# Altium schematic sheet LiIon Charger Protection Board.SchDoc
size 297 x 209 mm; Symbol: Drawing-Symbol_A4; Company: 嘉立创EDA; Version: V1.0; Page Size: A4; @Project Name: 锂电池充电板; @Update Date: 2026-08-12; @Create Date: 2026-08-12; Device: Drawing-Symbol_A4; @Board Name: Board1; @Page Name: P1; @Create Time: 10:04:04; @Page Count: 1; @Page No: 1; @Schematic Name: Schematic1; @Update Time: 10:04:04; @Assembly Variant: Basic; Border: 1; Title Block Position: 3; Size: A4; Width: 1170; Height: 825; Region Start: 1; X Region Count: 6; Y Region Count: 4; Blade Width: 10; SheetNumber: 1; SheetTotal: 1
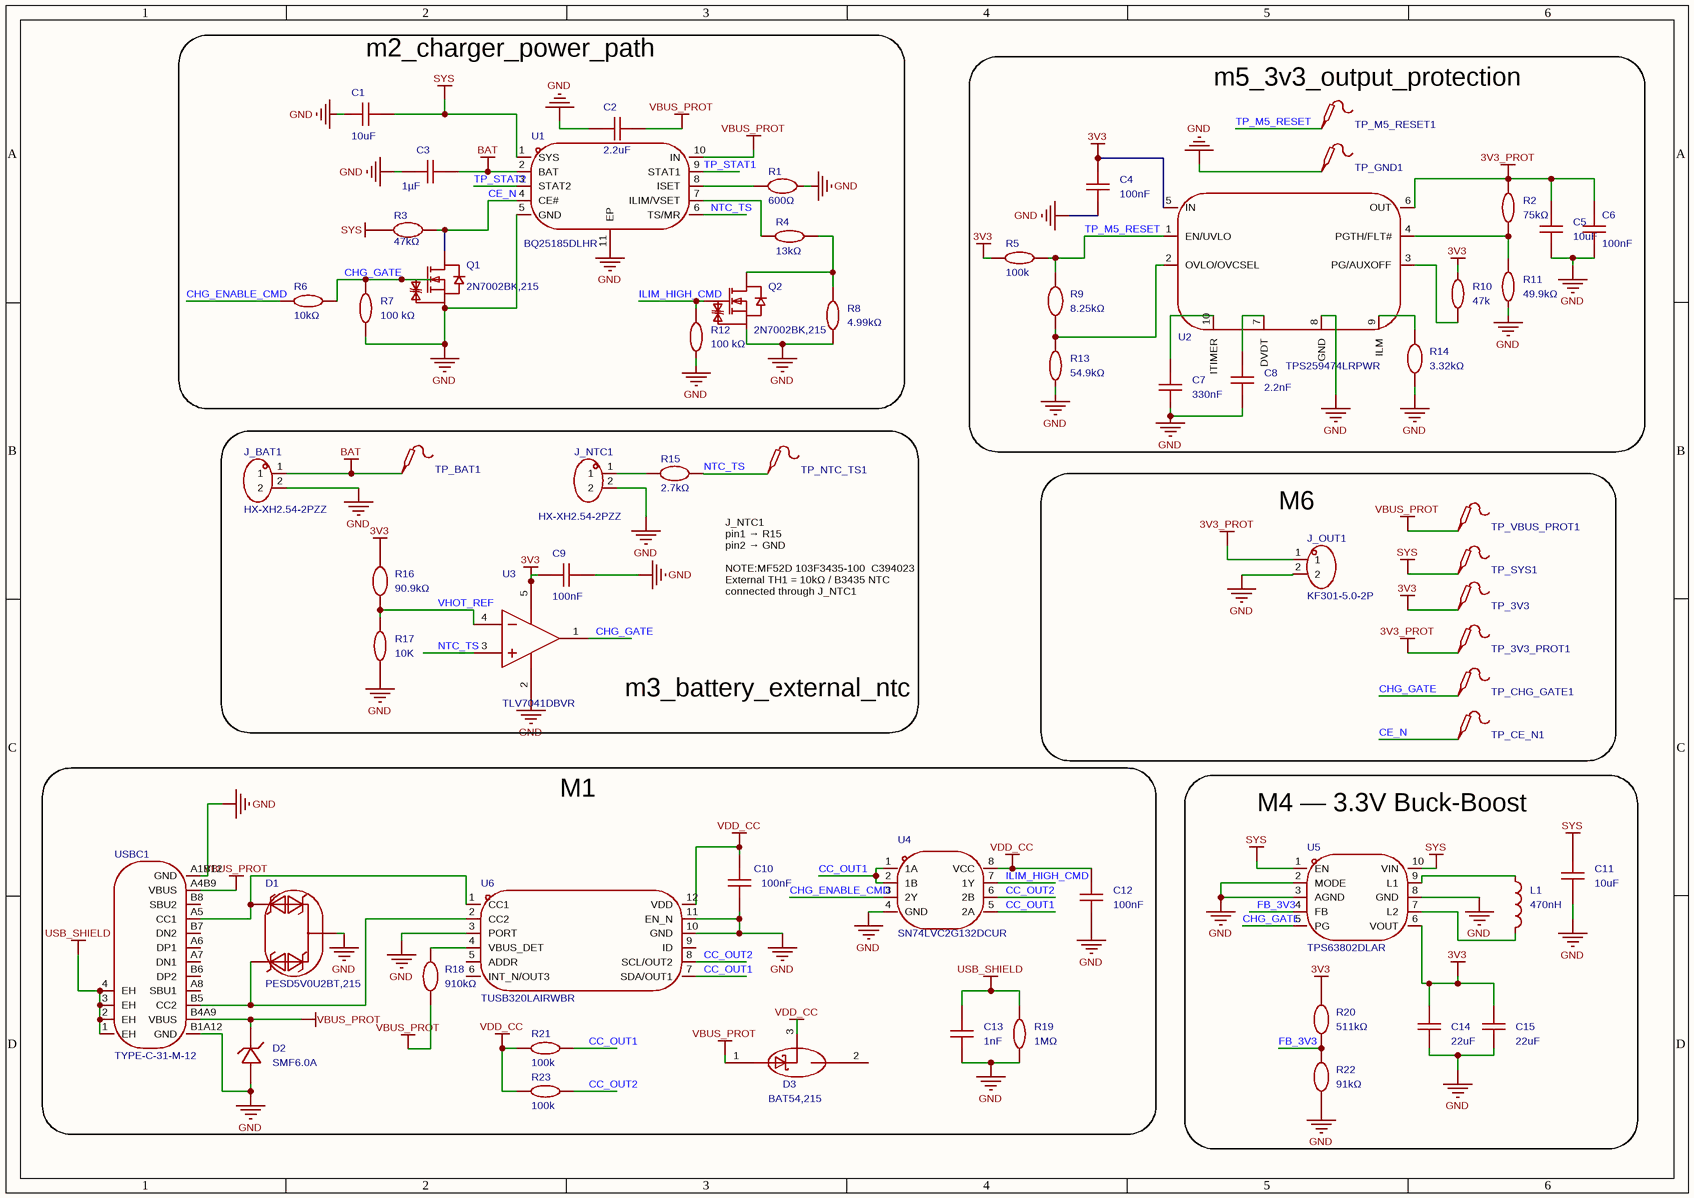
[diagram p0: LiIon Charger Protection Board.SchDoc]

## Parts
C1  10uF  [C0805]
C2  2.2uF  [C0603]
C3  1µF  [C0603]
C4  100nF  [C0603]
C5  10uF  [C0805]
C6  100nF  [C0603]
C7  330nF  [C0603]
C8  2.2nF  [C0603]
C9  100nF  [C0603]
C10  100nF  [C0603]
C11  10uF  [C0805]
C12  100nF  [C0603]
C13  1nF  [C1206]
C14  22uF  [C0805]
C15  22uF  [C0805]
D1  PESD5V0U2BT,215  [SOT-23-3_L2.9-W1.6-P1.90-LS2.8-BR]
D2  SMF6.0A  [SOD-123FL_L2.7-W1.8-LS3.8-RD]
D3  BAT54,215  [SOT-23_L2.9-W1.3-P1.90-LS2.4-BR]
J_BAT1  HX-XH2.54-2PZZ  [CONN-TH_2P-P2.50_HX-2.54MM-2P-ZZ-MS]
J_NTC1  HX-XH2.54-2PZZ  [CONN-TH_2P-P2.50_HX-2.54MM-2P-ZZ-MS]
J_OUT1  KF301-5.0-2P  [CONN-TH_P5.00_KF301-5.0-2P]
L1  470nH  [IND-SMD_L2.0-W1.6-1]
Q1  2N7002BK,215  [SOT-23-3_L3.0-W1.7-P0.95-LS2.9-BR]
Q2  2N7002BK,215  [SOT-23-3_L3.0-W1.7-P0.95-LS2.9-BR]
R1  600Ω  [R0805]
R2  75kΩ  [R0603]
R3  47kΩ  [R0603]
R4  13kΩ  [R0603]
R5  100k  [R0603]
R6  10kΩ  [R0603]
R7  100 kΩ  [R0603]
R8  4.99kΩ  [R0603]
R9  8.25kΩ  [R0603]
R10  47k  [R0603]
R11  49.9kΩ  [R0603]
R12  100 kΩ  [R0603]
R13  54.9kΩ  [R0603]
R14  3.32kΩ  [R0603]
R15  2.7kΩ  [R0603]
R16  90.9kΩ  [R0603]
R17  10K  [R0603]
R18  910kΩ  [R0603]
R19  1MΩ  [R1206]
R20  511kΩ  [R0603]
R21  100k  [R0603]
R22  91kΩ  [R0603]
R23  100k  [R0603]
TP_3V3  (no value)  [Test-Point-0.5mm]
TP_3V3_PROT1  (no value)  [Test-Point-0.5mm]
TP_BAT1  (no value)  [Test-Point-0.5mm]
TP_CE_N1  (no value)  [Test-Point-0.5mm]
TP_CHG_GATE1  (no value)  [Test-Point-0.5mm]
TP_GND1  (no value)  [Test-Point-0.5mm]
TP_M5_RESET1  (no value)  [Test-Point-0.5mm]
TP_NTC_TS1  (no value)  [Test-Point-0.5mm]
TP_SYS1  (no value)  [Test-Point-0.5mm]
TP_VBUS_PROT1  (no value)  [Test-Point-0.5mm]
U1  BQ25185DLHR  [WSON-10_L2.2-W2.0-P0.40-BL-EP_TI_DLH0010A]
U2  TPS259474LRPWR  [VQFN-10_L2.0-W2.0-P0.45-TL]
U3  TLV7041DBVR  [SOT-23-5_L2.9-W1.6-P0.95-LS2.8-BR]
U4  SN74LVC2G132DCUR  [US-8_L2.4-W2.1-P0.50-LS3.2-BR]
U5  TPS63802DLAR  [VSON-10_L3.0-W2.0-P0.50-TL]
U6  TUSB320LAIRWBR  [X2QFN-12_L1.6-W1.6-P0.40-TL]
USBC1  TYPE-C-31-M-12  [USB-C_SMD-TYPE-C-31-M-12_1]

## Blocks framed on the sheet
m2_charger_power_path: C1-C3 Q1 Q2 R1 R3 R4 R6-R8 R12 U1
m5_3v3_output_protection: C4-C8 R2 R5 R9-R11 R13 R14 TP_GND1 TP_M5_RESET1 U2
m3_battery_external_ntc: C9 J_BAT1 J_NTC1 R15-R17 TP_BAT1 TP_NTC_TS1 U3
M6: J_OUT1 TP_3V3 TP_3V3_PROT1 TP_CE_N1 TP_CHG_GATE1 TP_SYS1 TP_VBUS_PROT1
M1: C10 C12 C13 D1-D3 R18 R19 R21 R23 U4 U6 USBC1
M4 — 3.3V Buck-Boost: C11 C14 C15 L1 R20 R22 U5

## Nets
3V3: C4.2 C9.1 C14.2 C15.2 R5.1 R10.2 R16.2 R20.2 TP_3V3.1 U2.5(IN) U3.5(VCC) U5.6(VOUT)
3V3_PROT: C5.2 C6.2 J_OUT1.1 R2.2 TP_3V3_PROT1.1 U2.6(OUT)
BAT: C3.1 J_BAT1.1 TP_BAT1.1 U1.2(BAT)
GND: C1.1 C2.1 C3.2 C4.1 C5.1 C6.1 C7.1 C8.1 C9.2 C10.1 C11.1 C12.1 C13.1 C14.1 C15.1 D1.3 D2.2 J_BAT1.2 J_NTC1.2 J_OUT1.2 Q1.2(S) Q2.2(S) R1.2 R7.1 R8.1 R11.1 R12.1 R13.1 R14.1 R17.1 R19.1 R22.1 TP_GND1.1 U1.5(GND) U1.11(EP) U2.8(GND) U3.2(VEE) U4.4(GND) U5.2(MODE) U5.3(AGND) U5.8(GND) U6.3(PORT) U6.10(GND) U6.11(EN_N) USBC1.A1B12(GND) USBC1.B1A12(GND)
SYS: C1.2 C11.2 R3.2 TP_SYS1.1 U1.1(SYS) U5.1(EN) U5.10(VIN)
USB_SHIELD: C13.2 R19.2 USBC1.1(EH) USBC1.2(EH) USBC1.3(EH) USBC1.4(EH)
VBUS_PROT: C2.2 D2.1 D3.1(A) R18.1 TP_VBUS_PROT1.1 U1.10(IN) USBC1.A4B9(VBUS) USBC1.B4A9(VBUS)
VDD_CC: C10.2 C12.2 D3.3(C) R21.1 R23.2 U4.8(VCC) U6.12(VDD)
CC_OUT1: R21.2 U4.1(1A) U4.2(1B) U4.5(2A) U6.7(SDA/OUT1)
CC_OUT2: R23.1 U4.6(2B) U6.8(SCL/OUT2)
CE_N: Q1.3(D) R3.1 TP_CE_N1.1 U1.4(CE#)
CHG_ENABLE_CMD: R6.1 U4.3(2Y)
CHG_GATE: Q1.1(G) R6.2 R7.2 TP_CHG_GATE1.1 U3.1(OUT) U5.5(PG)
FB_3V3: R20.1 R22.2 U5.4(FB)
ILIM_HIGH_CMD: Q2.1(G) R12.2 U4.7(1Y)
NTC_TS: R15.2 TP_NTC_TS1.1 U1.6(TS/MR) U3.3(IN+)
TP_M5_RESET: R5.2 R9.2 TP_M5_RESET1.1 U2.1(EN/UVLO)
TP_STAT1: U1.9(STAT1)
TP_STAT2: U1.3(STAT2)
VHOT_REF: R16.1 R17.2 U3.4(IN-)
NetC7_2: C7.2 U2.10(ITIMER)
NetC8_2: C8.2 U2.7(DVDT)
NetD1_1: D1.1 U6.1(CC1) USBC1.A5(CC1)
NetD1_2: D1.2 U6.2(CC2) USBC1.B5(CC2)
NetJ_NTC1_1: J_NTC1.1 R15.1
NetL1_1: L1.1 U5.9(L1)
NetL1_2: L1.2 U5.7(L2)
NetQ2_3: Q2.3(D) R4.2 R8.2
NetR1_1: R1.1 U1.8(ISET)
NetR2_1: R2.1 R11.2 U2.4(PGTH/FLT#)
NetR4_1: R4.1 U1.7(ILIM/VSET)
NetR9_1: R9.1 R13.2 U2.2(OVLO/OVCSEL)
NetR10_1: R10.1 U2.3(PG/AUXOFF)
NetR14_2: R14.2 U2.9(ILM)
NetR18_2: R18.2 U6.4(VBUS_DET)

Not connected (* = marked no-connect by the designer): D3 2(NC); U6 5(ADDR) 6(INT_N/OUT3) 9(ID); USBC1 A6(DP1) A7(DN1) A8(SBU1) B6(DP2) B7(DN2) B8(SBU2)

## Notes on the sheet
- J_NTC1
  pin1 → R15
  pin2 → GND
  NOTE:MF52D 103F3435-100  C394023
  External TH1 = 10kΩ / B3435 NTC
  connected through J_NTC1

## Library data of the parts
C1 C5 C11 = CL21A106KAYNNNE_C15850: 容值:10uF;精度:±10%;额定电压:25V;温度系数:X5R;; Manufacturer: SAMSUNG(三星); Add into BOM: yes; 3D Model: 1ba041120af144c991958decab20d241; 3D Model Transform: 78.74,51.181,0,0,0,0,0,0.0005,0; Tolerance: ±10%; Voltage Rating: 25V; Temperature Coefficient: X5R; ModelName: C0805_L2.0-W1.3-H1.3; Symbol: CL21A106KAYNNNE; Device: CL21A106KAYNNNE_C15850; Convert to PCB: yes; Value: 10uF; Supplier Footprint: 0805; LCSC Part Name: 10uF ±10% 25V; Supplier Part: C15850; Manufacturer Part: CL21A106KAYNNNE; JLCPCB Part Class: Basic Part; Datasheet: https://item.szlcsc.com/datasheet/CL21A106KAYNNNE/16532.html; Supplier: LCSC; FootprintName: C0805
C2 = CL10A225KA8NNNC: 容值:2.2uF;精度:±10%;额定电压:25V;温度系数:X5R;; Manufacturer: SAMSUNG(三星); Add into BOM: yes; 3D Model: ac125912035d415993ca9572d50418b1; 3D Model Transform: 62.992,31.496,0,0,0,0,0,0,0; Tolerance: ±10%; Voltage Rating: 25V; Temperature Coefficient: X5R; ModelName: C0603_L1.6-W0.8-H0.8; Symbol: CL10A225KA8NNNC; Device: CL10A225KA8NNNC; Convert to PCB: yes; Value: 2.2uF; Supplier Footprint: 0603; LCSC Part Name: 2.2uF ±10% 25V; Supplier Part: C57895; Manufacturer Part: CL10A225KA8NNNC; JLCPCB Part Class: Extended Part; Datasheet: https://item.szlcsc.com/datasheet/CL10A225KA8NNNC/58932.html; Supplier: LCSC; FootprintName: C0603
C3 C9 = CAP_0603: Symbol: Capacitance; ConvertToPcb: yes; ModelId: ac125912035d415993ca9572d50418b1聨0819f05c4eef4c71ace90d822a990e87; ModelName: C0603_L1.6-W0.8-H0.8; ModelTransform: 62.992,31.496,0,0,0,0,0,0,0; Device: CAP_0603; AddInBom: yes; Supplier Footprint: 0603; FootprintName: C0603
  C3: Value: 1µF
  C9: Value: 100nF
C4 C6-C8 C10 C12 = CAP_0603: Symbol: Capacitance; 3D Model: ac125912035d415993ca9572d50418b1聨0819f05c4eef4c71ace90d822a990e87; 3D Model Transform: 62.992,31.496,0,0,0,0,0,0,0; ConvertToPcb: yes; ModelName: C0603_L1.6-W0.8-H0.8; Device: CAP_0603; Supplier Footprint: 0603; AddInBom: yes; FootprintName: C0603
  C4 C6 C10 C12: Value: 100nF
  C7: Value: 330nF
  C8: Value: 2.2nF
C13 = GRM31C5C3A102JWA3L: 容值:1nF;精度:±5%;额定电压:1kV;温度系数:C0G;; Manufacturer: muRata(村田); AddInBom: yes; ModelId: e4be705b945545a48e666415e3682bd8聨0819f05c4eef4c71ace90d822a990e87; ModelName: C1206_L3.2-W1.6-H1.3; ModelTransform: 125.984,62.992,0,0,0,0,0,0,0; Tolerance: ±5%; Voltage Rating: 1kV; Temperature Coefficient: C0G; Symbol: GRM31C5C3A102JWA3L; Device: GRM31C5C3A102JWA3L; LCSC Part Name: 1nF ±5% 1kV; SupplierPart: C521240; ManufacturerPart: GRM31C5C3A102JWA3L; Supplier Footprint: 1206; JLCPCB Part Class: Extended Part; Datasheet: https://item.szlcsc.com/datasheet/GRM31C5C3A102JWA3L/538323.html; Supplier: LCSC; ConvertToPcb: yes; FootprintName: C1206; Value: 1nF
C14 C15 = GRM21BR61E226ME44L: 容值:22uF;精度:±20%;额定电压:25V;温度系数:X5R;; Manufacturer: muRata(村田); Add into BOM: yes; 3D Model: 1ba041120af144c991958decab20d241; 3D Model Transform: 78.74,51.181,0,0,0,0,0,0.0005,0; Tolerance: ±20%; Voltage Rating: 25V; Temperature Coefficient: X5R; ModelName: C0805_L2.0-W1.3-H1.3; Symbol: GRM21BR61E226ME44L; Device: GRM21BR61E226ME44L; Convert to PCB: yes; Supplier Footprint: 0805; Value: 22uF; LCSC Part Name: 22uF ±20% 25V; Supplier Part: C86816; Manufacturer Part: GRM21BR61E226ME44L; JLCPCB Part Class: Extended Part; Datasheet: https://item.szlcsc.com/datasheet/GRM21BR61E226ME44L/87993.html; Supplier: LCSC; FootprintName: C0805
D1 = PESD5V0U2BT,215: 极性:双向;反向截止电压(Vrwm):5V;击穿电压:5.5V;; Manufacturer: Nexperia(安世); AddInBom: yes; ModelId: 89cb27a44ab2466697082bb9fd73a7d0聨0819f05c4eef4c71ace90d822a990e87; ModelName: SOT-23-3L_L2.9-W1.6-H1.1-LS2.8-P0.95; ModelTransform: 114.173,110.236,0,90,0,0,0,0,0; Polarity: 双向; Reverse Stand-Off Voltage (Vrwm): 5V; Voltage - Breakdown: 5.5V; Reverse Leakage Current (Ir): 5nA; Number of Channels: 双路; level of protection: IEC 61000-4-2; Type: ESD; Junction Capacitance: 2.9pF; Symbol: PESD5V0U2BT,215; Device: PESD5V0U2BT,215; LCSC Part Name: 双向ESD; SupplierPart: C85399; ManufacturerPart: PESD5V0U2BT,215; Supplier Footprint: SOT-23; JLCPCB Part Class: Extended Part; Datasheet: https://item.szlcsc.com/datasheet/PESD5V0U2BT%252C215/86572.html; Supplier: LCSC; ConvertToPcb: yes; FootprintName: SOT-23-3_L2.9-W1.6-P1.90-LS2.8-BR; Operating Temperature: -65℃~+150℃@(Ta)
D2 = SMF6.0A_C207260: 极性:单向;反向截止电压(Vrwm):6V;钳位电压:10.3V;峰值脉冲电流(Ipp):19.4A@10/1000us;峰值脉冲功率(Ppp):200W@10/1000us;击穿电压(VBR):7.37V;; Manufacturer: Littelfuse(美国力特); AddInBom: yes; ModelId: 86f9151e155e4fe2af0c4f2e0a80302e聨0819f05c4eef4c71ace90d822a990e87; ModelName: SOD-123FL_L2.8-W1.8-H1.1-LS3.6; ModelTransform: 141.732,70.866,0,180,0,0,0,0,0; Polarity: 单向; Reverse Stand-Off Voltage (Vrwm): 6V; Clamping Voltage: 10.3V; Voltage - Breakdown: 7.37V; Reverse Leakage Current (Ir): 400uA; level of protection: IEC 61000-4-4；IEC 61000-4-2; Type: TVS; Symbol: SMF6.0A_C207260; Device: SMF6.0A_C207260; LCSC Part Name: VBR=7.37V ，Vc=10.3V， Ipp=19.4A; SupplierPart: C207260; ManufacturerPart: SMF6.0A; Supplier Footprint: SOD-123FL; JLCPCB Part Class: Extended Part; Datasheet: https://item.szlcsc.com/datasheet/SMF6.0A/208379.html; Supplier: LCSC; ConvertToPcb: yes; FootprintName: SOD-123FL_L2.7-W1.8-LS3.8-RD; Peak Pulse Current (Ipp): 19.4A@10/1000us; Peak Pulse Power Dissipation (Ppp): 200W@10/1000us; Number of Channels: -; Operating Temperature: -65℃~+150℃; Junction Capacitance: -
D3 = BAT54,215: 正向压降(Vf):800mV@100mA;直流反向耐压(Vr):30V;整流电流:200mA;; Manufacturer: Nexperia(安世); AddInBom: yes; ModelId: c62791f0466c4ae2a892c056b845b0ca聨0819f05c4eef4c71ace90d822a990e87; ModelName: SOT-23-3P_L2.9-W1.3-H1.0-LS2.4-P0.95; ModelTransform: 98.64468,114.173,0,180,0,0,0.001,-0.002,0; Voltage - DC Reverse(Vr): 30V; Current - Rectified: 200mA; Reverse Leakage Current (Ir): 2uA@25V; Non-Repetitive Peak Forward Surge Current: 600mA; Symbol: BAT54,215; Device: BAT54,215; LCSC Part Name: 电压:30V 电流:200mA; SupplierPart: C85084; ManufacturerPart: BAT54,215; Supplier Footprint: SOT-23; JLCPCB Part Class: Extended Part; Datasheet: https://item.szlcsc.com/datasheet/BAT54%252C215/86256.html; Supplier: LCSC; ConvertToPcb: yes; FootprintName: SOT-23_L2.9-W1.3-P1.90-LS2.4-BR; Voltage - Forward(Vf@If): 800mV@100mA
J_BAT1 J_NTC1 = HX-XH2.54-2PZZ: 插针结构:1x2P;间距:2.54mm;安装方式:直插;参考系列:XH;总PIN数:2P;排数:1;每排PIN数:2;行距:-;额定电流:3A;触头材质:黄铜;触头镀层:锡;工作温度:-25℃~+85℃;; Manufacturer: hanxia(韩下); AddInBom: yes; ModelId: 1cafe43f43c04794b29c478db770ea2f聨0819f05c4eef4c71ace90d822a990e87; ModelTransform: 295.275,228.7397,0,0,0,0,0,-19.685,-137.795; Pins Structure: 1x2P; Pitch: 2.54mm; Reference Series: XH; Number of PINs Per Row: 2; Current Rating: 3A; Voltage Rating: 250V; Plastic Material: PA66; Flame Retardant Rating: UL94V-0; Symbol: HX-XH2.54-2PZZ; Device: HX-XH2.54-2PZZ; LCSC Part Name: 1x2P 间距:2.54mm 直插 系列:XH; SupplierPart: C42391660; Supplier Footprint: 插件,P=2.5mm; JLCPCB Part Class: Extended Part; Datasheet: https://item.szlcsc.com/datasheet/HX-XH2.54-2PZZ/44326932.html; Supplier: LCSC; ConvertToPcb: yes; FootprintName: CONN-TH_2P-P2.50_HX-2.54MM-2P-ZZ-MS; ModelName: CONN-TH_2P-P2.50_HX-2.54MM-2P-ZZ-MS; Mounting Type: 直插; Number of Pins: 2P; Number of Rows: 1; Row Spacing: -; Contact Material: 黄铜; Contact Plating: 锡; Operating Temperature: -25℃~+85℃; Color: 白色
  J_BAT1: ManufacturerPart: HX-XH2.54-2PZZ
  J_NTC1: Manufacturer Part: HX-XH2.54-2PZZ
J_OUT1 = KF301-5.0-2P: 结构:1x2P;间距:5mm;颜色:蓝色;安装方式:直插;排数:1;每排PIN数:2;额定电流:17A;额定电压:250V;线规 - AWG:14~22;线规 - 平方毫米:1.5;工作温度:-30℃~+120℃;; Manufacturer: KEFA(科发); AddInBom: yes; ModelId: 442de893d0fc4728b9e5c7abc29ccda5聨0819f05c4eef4c71ace90d822a990e87; ModelTransform: 417.322,299.21594,0,0,0,0,11.811,7.874,-137.795; Number of Positions or Pins: 1x2P; Pitch: 5mm; Number of PINs Per Row: 2; Current Rating: 17A; Voltage Rating (Max): 250V; Wire Gauge - AWG: 14~22; Wire Gauge - mm2: 1.5; Symbol: KF301-5.0-2P; Device: KF301-5.0-2P; LCSC Part Name: 1x2P 5mm 直插 排数:1 每排P数:2; SupplierPart: C474881; ManufacturerPart: KF301-5.0-2P; Supplier Footprint: 插件,P=5mm; JLCPCB Part Class: Extended Part; Datasheet: https://item.szlcsc.com/datasheet/KF301-5.0-2P/481499.html; Supplier: LCSC; ConvertToPcb: yes; FootprintName: CONN-TH_P5.00_KF301-5.0-2P; ModelName: CONN-TH_P5.00_KF301-5.0-2P; Color: 蓝色; Mounting Type: 直插; Number of Pins: 2P; Number of Rows: 1; Operating Temperature: -30℃~+120℃
L1 = DFE201612E-R47M=P2: 电感值:470nH;精度:±20%;额定电流:4.5A;饱和电流(Isat):5.5A;; Manufacturer: muRata(村田); Add into BOM: yes; 3D Model: e46c02e66e4b482b810d7eae4ef76c7b; 3D Model Transform: 78.74,62.992,0,0,0,0,0,-0.003,0; Tolerance: ±20%; Current Rating: 4.5A; Current - Saturation(Isat): 5.5A; DC Resistance(DCR): 26mΩ; Symbol: DFE201612E-R47M=P2; Device: DFE201612E-R47M=P2; Convert to PCB: yes; LCSC Part Name: 470nH ±20% 5.5A; Supplier Part: C668312; Manufacturer Part: DFE201612E-R47M=P2; Supplier Footprint: 0806; JLCPCB Part Class: Extended Part; Datasheet: https://atta.szlcsc.com/upload/public/pdf/source/20220704/803E7827D5B93CBE7ABCC328F9E8474C.pdf; Supplier: LCSC; Value: 470nH; Ratings: -; FootprintName: IND-SMD_L2.0-W1.6-1; ModelName: IND-SMD_L2.0-W1.6-1
Q1 Q2 = 2N7002BK,215: 数量:1个N沟道;漏源电压(Vdss):60V;连续漏极电流(Id):350mA;导通电阻(RDS(on)):1.6Ω@10V;耗散功率(Pd):370mW;阈值电压(Vgs(th)):2.1V;; Manufacturer: Nexperia(安世); AddInBom: yes; ModelId: 89cb27a44ab2466697082bb9fd73a7d0聨0819f05c4eef4c71ace90d822a990e87; ModelName: SOT-23-3L_L2.9-W1.6-H1.1-LS2.8-P0.95; ModelTransform: 114.173,110.236,0,90,0,0,0,0,0; Number: 1个N沟道; Drain to Source Voltage: 60V; Current - Continuous Drain(Id): 350mA; Pd - Power Dissipation: 370mW; Gate Threshold Voltage (Vgs(th)): 2.1V; Gate Charge(Qg): 600pC@4.5V; Input Capacitance(Ciss): 50pF; Reverse Transfer Capacitance (Crss@Vds): 4pF; Type: N沟道; Symbol: 2N7002BK,215; Device: 2N7002BK,215; LCSC Part Name: 1个N沟道 耐压:60V 电流:350mA; SupplierPart: C282405; ManufacturerPart: 2N7002BK,215; Supplier Footprint: SOT-23; JLCPCB Part Class: Extended Part; Datasheet: https://item.szlcsc.com/datasheet/2N7002BK%252C215/268403.html; Supplier: LCSC; ConvertToPcb: yes; FootprintName: SOT-23-3_L3.0-W1.7-P0.95-LS2.9-BR; RDS(on): 1.6Ω@10V; Operating Temperature: -55℃~+150℃
R1 = CRCW0805600RFKEAHP: 阻值:600Ω;精度:±1%;功率:500mW;工作电压:150V;温度系数:±100ppm/℃;; Manufacturer: VISHAY(威世); Add into BOM: yes; 3D Model: 37a81e68749a4138bd2dfa6897b24b85; 3D Model Transform: 78.74,51.181,0,0,0,0,0,-0.0005,0; Tolerance: ±1%; Power(Watts): 500mW; Voltage-Supply(Max): 150V; ModelName: R0805_L2.0-W1.3-H0.6; Symbol: CRCW0805600RFKEAHP; Device: CRCW0805600RFKEAHP; Convert to PCB: yes; Value: 600Ω; Supplier Footprint: 0805; LCSC Part Name: 脉冲耐受、高功率厚膜片式电阻; Supplier Part: C19725604; Manufacturer Part: CRCW0805600RFKEAHP; JLCPCB Part Class: Extended Part; Datasheet: https://item.szlcsc.com/datasheet/CRCW0805600RFKEAHP/21048958.html; Supplier: LCSC; Temperature Coefficient: ±100ppm/℃; Operating Temperature: -55℃~+155℃; FootprintName: R0805
R2 = 0603WAF7502T5E: 电阻类型:厚膜电阻;阻值:75kΩ;精度:±1%;功率:100mW;工作电压:75V;温度系数:±100ppm/℃;; Manufacturer: UNI-ROYAL(厚声); Add into BOM: yes; 3D Model: fc143cca1e79419f9cd78b61e9279f08; 3D Model Transform: 31.8897,63.7794,0,90,0,0,0,0,0; Tolerance: ±1%; Power(Watts): 100mW; Voltage-Supply(Max): 75V; Symbol: 0603WAF7502T5E; Device: 0603WAF7502T5E; Convert to PCB: yes; Supplier Footprint: 0603; Value: 75kΩ; LCSC Part Name: 75kΩ ±1% 100mW 厚膜电阻; Supplier Part: C23242; Manufacturer Part: 0603WAF7502T5E; JLCPCB Part Class: Basic Part; Datasheet: https://item.szlcsc.com/datasheet/0603WAF7502T5E/23969.html; Supplier: LCSC; Type: 厚膜电阻; Temperature Coefficient: ±100ppm/℃; Operating Temperature: -55℃~+155℃; FootprintName: R0603; ModelName: R0603
R3 = FRC0603F4702TS: 电阻类型:厚膜电阻;阻值:47kΩ;精度:±1%;功率:100mW;工作电压:75V;温度系数:±100ppm/℃;; Manufacturer: FOJAN(富捷); Add into BOM: yes; 3D Model: fc143cca1e79419f9cd78b61e9279f08; 3D Model Transform: 31.8897,63.7794,0,90,0,0,0,0,0; Tolerance: ±1%; Power(Watts): 100mW; Voltage-Supply(Max): 75V; Symbol: FRC0603F4702TS; Device: FRC0603F4702TS; Convert to PCB: yes; Value: 47kΩ; Supplier Footprint: 0603; LCSC Part Name: 47kΩ ±1% 100mW 厚膜电阻; Supplier Part: C2907042; Manufacturer Part: FRC0603F4702TS; JLCPCB Part Class: Extended Part; Supplier: LCSC; Type: 厚膜电阻; Temperature Coefficient: ±100ppm/℃; Operating Temperature: -55℃~+155℃; FootprintName: R0603; ModelName: R0603
R4 = 0603WAF1302T5E: 电阻类型:厚膜电阻;阻值:13kΩ;精度:±1%;功率:100mW;工作电压:75V;温度系数:±100ppm/℃;; Manufacturer: UNI-ROYAL(厚声); Add into BOM: yes; 3D Model: fc143cca1e79419f9cd78b61e9279f08; 3D Model Transform: 31.8897,63.7794,0,90,0,0,0,0,0; Tolerance: ±1%; Power(Watts): 100mW; Voltage-Supply(Max): 75V; Symbol: 0603WAF1302T5E; Device: 0603WAF1302T5E; Convert to PCB: yes; Value: 13kΩ; Supplier Footprint: 0603; LCSC Part Name: 13kΩ ±1% 100mW 厚膜电阻; Supplier Part: C22797; Manufacturer Part: 0603WAF1302T5E; JLCPCB Part Class: Basic Part; Datasheet: https://item.szlcsc.com/datasheet/0603WAF1302T5E/23524.html; Supplier: LCSC; Type: 厚膜电阻; Temperature Coefficient: ±100ppm/℃; Operating Temperature: -55℃~+155℃; FootprintName: R0603; ModelName: R0603
R5 R10 R21 R23 = Res_0603: Symbol: 电阻; 3D Model: fc143cca1e79419f9cd78b61e9279f08聨0819f05c4eef4c71ace90d822a990e87; 3D Model Transform: 31.8897,63.7794,0,90,0,0,0,0,0; ConvertToPcb: yes; Device: Res_0603; Supplier Footprint: 0603; AddInBom: yes; FootprintName: R0603; ModelName: R0603
  R5 R21 R23: Value: 100k
  R10: Value: 47k
R6 R7 R12 R17 = Res_0603: Symbol: 电阻; ConvertToPcb: yes; ModelId: fc143cca1e79419f9cd78b61e9279f08聨0819f05c4eef4c71ace90d822a990e87; ModelTransform: 31.8897,63.7794,0,90,0,0,0,0,0; Device: Res_0603; AddInBom: yes; Supplier Footprint: 0603; FootprintName: R0603; ModelName: R0603
  R6: Value: 10kΩ
  R7 R12: Value: 100 kΩ
  R17: Value: 10K
R8 = 0603WAF4991T5E: 电阻类型:厚膜电阻;阻值:4.99kΩ;精度:±1%;功率:100mW;工作电压:75V;温度系数:±100ppm/℃;; Manufacturer: UNI-ROYAL(厚声); Add into BOM: yes; 3D Model: fc143cca1e79419f9cd78b61e9279f08; 3D Model Transform: 31.8897,63.7794,0,90,0,0,0,0,0; Tolerance: ±1%; Power(Watts): 100mW; Voltage-Supply(Max): 75V; Symbol: 0603WAF4991T5E; Device: 0603WAF4991T5E; Convert to PCB: yes; Value: 4.99kΩ; Supplier Footprint: 0603; LCSC Part Name: 4.99kΩ ±1% 100mW 厚膜电阻; Supplier Part: C23046; Manufacturer Part: 0603WAF4991T5E; JLCPCB Part Class: Basic Part; Datasheet: https://item.szlcsc.com/datasheet/0603WAF4991T5E/23773.html; Supplier: LCSC; Type: 厚膜电阻; Temperature Coefficient: ±100ppm/℃; Operating Temperature: -55℃~+155℃; FootprintName: R0603; ModelName: R0603
R9 = FRC0603F8251TS: 电阻类型:厚膜电阻;阻值:8.25kΩ;精度:±1%;功率:100mW;工作电压:75V;温度系数:±100ppm/℃;; Manufacturer: FOJAN(富捷); Add into BOM: yes; 3D Model: fc143cca1e79419f9cd78b61e9279f08; 3D Model Transform: 31.8897,63.7794,0,90,0,0,0,0,0; Tolerance: ±1%; Power(Watts): 100mW; Voltage-Supply(Max): 75V; Symbol: FRC0603F8251TS; Device: FRC0603F8251TS; Convert to PCB: yes; Supplier Footprint: 0603; Value: 8.25kΩ; LCSC Part Name: 8.25kΩ ±1% 100mW 厚膜电阻; Supplier Part: C2933261; Manufacturer Part: FRC0603F8251TS; JLCPCB Part Class: Extended Part; Datasheet: https://item.szlcsc.com/datasheet/FRC0603F8251TS/3279363.html; Supplier: LCSC; Type: 厚膜电阻; Temperature Coefficient: ±100ppm/℃; Operating Temperature: -55℃~+155℃; FootprintName: R0603; ModelName: R0603
R11 = 0603WAF4992T5E: 电阻类型:厚膜电阻;阻值:49.9kΩ;精度:±1%;功率:100mW;工作电压:75V;温度系数:±100ppm/℃;; Manufacturer: UNI-ROYAL(厚声); Add into BOM: yes; 3D Model: fc143cca1e79419f9cd78b61e9279f08; 3D Model Transform: 31.8897,63.7794,0,90,0,0,0,0,0; Tolerance: ±1%; Power(Watts): 100mW; Voltage-Supply(Max): 75V; Symbol: 0603WAF4992T5E; Device: 0603WAF4992T5E; Convert to PCB: yes; Supplier Footprint: 0603; Value: 49.9kΩ; LCSC Part Name: 49.9kΩ ±1% 100mW 厚膜电阻; Supplier Part: C23184; Manufacturer Part: 0603WAF4992T5E; JLCPCB Part Class: Basic Part; Datasheet: https://item.szlcsc.com/datasheet/0603WAF4992T5E/23911.html; Supplier: LCSC; Type: 厚膜电阻; Temperature Coefficient: ±100ppm/℃; Operating Temperature: -55℃~+155℃; FootprintName: R0603; ModelName: R0603
R13 = 0603WAF5492T5E: 电阻类型:厚膜电阻;阻值:54.9kΩ;精度:±1%;功率:100mW;最大工作电压:75V;温度系数:±100ppm/℃;; Manufacturer: UNI-ROYAL(厚声); Add into BOM: yes; 3D Model: fc143cca1e79419f9cd78b61e9279f08; 3D Model Transform: 31.8897,63.7794,0,90,0,0,0,0,0; Tolerance: ±1%; Power(Watts): 100mW; Overload Voltage (Max): 75V; Symbol: 0603WAF5492T5E; Device: 0603WAF5492T5E; Convert to PCB: yes; Supplier Footprint: 0603; Value: 54.9kΩ; LCSC Part Name: 54.9kΩ ±1% 100mW 厚膜电阻; Supplier Part: C23077; Manufacturer Part: 0603WAF5492T5E; JLCPCB Part Class: Extended Part; Datasheet: https://atta.szlcsc.com/upload/public/pdf/source/20200306/C422600_1E6D84923E4A46A82E41ADD87F860B5C.pdf; Supplier: LCSC; Type: 厚膜电阻; Temperature Coefficient: ±100ppm/℃; Operating Temperature Range: -55℃~+155℃; FootprintName: R0603; ModelName: R0603
R14 = FRC0603F3321TS: 电阻类型:厚膜电阻;阻值:3.32kΩ;精度:±1%;功率:100mW;工作电压:75V;温度系数:±100ppm/℃;; Manufacturer: FOJAN(富捷); Add into BOM: yes; 3D Model: fc143cca1e79419f9cd78b61e9279f08; 3D Model Transform: 31.8897,63.7794,0,90,0,0,0,0,0; Tolerance: ±1%; Power(Watts): 100mW; Voltage-Supply(Max): 75V; Symbol: FRC0603F3321TS; Device: FRC0603F3321TS; Convert to PCB: yes; Supplier Footprint: 0603; Value: 3.32kΩ; LCSC Part Name: 3.32kΩ ±1% 100mW 厚膜电阻; Supplier Part: C2930088; Manufacturer Part: FRC0603F3321TS; JLCPCB Part Class: Extended Part; Supplier: LCSC; Type: 厚膜电阻; Temperature Coefficient: ±100ppm/℃; Operating Temperature: -55℃~+155℃; FootprintName: R0603; ModelName: R0603
R15 = FRC0603F2701TS: 电阻类型:厚膜电阻;阻值:2.7kΩ;精度:±1%;功率:100mW;工作电压:75V;温度系数:±100ppm/℃;; Manufacturer: FOJAN(富捷); Add into BOM: yes; 3D Model: fc143cca1e79419f9cd78b61e9279f08; 3D Model Transform: 31.8897,63.7794,0,90,0,0,0,0,0; Tolerance: ±1%; Power(Watts): 100mW; Voltage-Supply(Max): 75V; Symbol: FRC0603F2701TS; Device: FRC0603F2701TS; Convert to PCB: yes; Value: 2.7kΩ; Supplier Footprint: 0603; LCSC Part Name: 2.7kΩ ±1% 100mW 厚膜电阻; Supplier Part: C2907008; Manufacturer Part: FRC0603F2701TS; JLCPCB Part Class: Extended Part; Datasheet: https://item.szlcsc.com/datasheet/FRC0603F2701TS/3180521.html; Supplier: LCSC; Type: 厚膜电阻; Temperature Coefficient: ±100ppm/℃; Operating Temperature: -55℃~+155℃; FootprintName: R0603; ModelName: R0603
R16 = FRC0603F9092TS: 电阻类型:厚膜电阻;阻值:90.9kΩ;精度:±1%;功率:100mW;工作电压:75V;温度系数:±100ppm/℃;; Manufacturer: FOJAN(富捷); Add into BOM: yes; 3D Model: fc143cca1e79419f9cd78b61e9279f08; 3D Model Transform: 31.8897,63.7794,0,90,0,0,0,0,0; Tolerance: ±1%; Power(Watts): 100mW; Voltage-Supply(Max): 75V; Symbol: FRC0603F9092TS; Device: FRC0603F9092TS; Convert to PCB: yes; Value: 90.9kΩ; Supplier Footprint: 0603; LCSC Part Name: 90.9kΩ ±1% 100mW 厚膜电阻; Supplier Part: C2930136; Manufacturer Part: FRC0603F9092TS; JLCPCB Part Class: Extended Part; Datasheet: https://item.szlcsc.com/datasheet/FRC0603F9092TS/3267069.html; Supplier: LCSC; Type: 厚膜电阻; Temperature Coefficient: ±100ppm/℃; Operating Temperature: -55℃~+155℃; FootprintName: R0603; ModelName: R0603
R18 = FRC0603F9103TS: 电阻类型:厚膜电阻;阻值:910kΩ;精度:±1%;功率:100mW;工作电压:75V;温度系数:±100ppm/℃;; Manufacturer: FOJAN(富捷); Add into BOM: yes; 3D Model: fc143cca1e79419f9cd78b61e9279f08; 3D Model Transform: 31.8897,63.7794,0,90,0,0,0,0,0; Tolerance: ±1%; Power(Watts): 100mW; Voltage-Supply(Max): 75V; Symbol: FRC0603F9103TS; Device: FRC0603F9103TS; Convert to PCB: yes; Supplier Footprint: 0603; Value: 910kΩ; LCSC Part Name: 910kΩ ±1% 100mW 厚膜电阻; Supplier Part: C2907075; Manufacturer Part: FRC0603F9103TS; JLCPCB Part Class: Extended Part; Supplier: LCSC; Type: 厚膜电阻; Temperature Coefficient: ±100ppm/℃; Operating Temperature: -55℃~+155℃; FootprintName: R0603; ModelName: R0603
R19 = RC1206FR-071ML: 电阻类型:厚膜电阻;阻值:1MΩ;精度:±1%;功率:250mW;最大工作电压:200V;温度系数:±100ppm/℃;; Manufacturer: YAGEO(国巨); AddInBom: yes; ModelId: 89a1f13db2384da588040e0b3c55bf66聨0819f05c4eef4c71ace90d822a990e87; ModelName: R1206_L3.2-W1.6-H0.6; ModelTransform: 125.984,62.992,0,0,0,0,0,0,0; Tolerance: ±1%; Power(Watts): 250mW; Overload Voltage (Max): 200V; Symbol: RC1206FR-071ML; Device: RC1206FR-071ML; LCSC Part Name: 厚膜电阻 1MΩ ±1% 250mW; SupplierPart: C108083; ManufacturerPart: RC1206FR-071ML; Supplier Footprint: 1206; JLCPCB Part Class: Extended Part; Datasheet: https://atta.szlcsc.com/upload/public/pdf/source/20180821/C275644_0D56F95EFF785E7D9A1FEF436B37DA78.pdf; Supplier: LCSC; ConvertToPcb: yes; FootprintName: R1206; Type: 厚膜电阻; Value: 1MΩ; Temperature Coefficient: ±100ppm/℃; Operating Temperature Range: -55℃~+155℃
R20 = FRC0603F5113TS: 电阻类型:厚膜电阻;阻值:511kΩ;精度:±1%;功率:100mW;工作电压:75V;温度系数:±100ppm/℃;; Manufacturer: FOJAN(富捷); Add into BOM: yes; 3D Model: fc143cca1e79419f9cd78b61e9279f08; 3D Model Transform: 31.8897,63.7794,0,90,0,0,0,0,0; Tolerance: ±1%; Power(Watts): 100mW; Voltage-Supply(Max): 75V; Symbol: FRC0603F5113TS; Device: FRC0603F5113TS; Convert to PCB: yes; Supplier Footprint: 0603; Value: 511kΩ; LCSC Part Name: 511kΩ ±1% 100mW 厚膜电阻; Supplier Part: C2930114; Manufacturer Part: FRC0603F5113TS; JLCPCB Part Class: Extended Part; Datasheet: https://item.szlcsc.com/datasheet/FRC0603F5113TS/3267047.html; Supplier: LCSC; Type: 厚膜电阻; Temperature Coefficient: ±100ppm/℃; Operating Temperature: -55℃~+155℃; FootprintName: R0603; ModelName: R0603
R22 = FRC0603F9102TS: 电阻类型:厚膜电阻;阻值:91kΩ;精度:±1%;功率:100mW;工作电压:75V;温度系数:±100ppm/℃;; Manufacturer: FOJAN(富捷); Add into BOM: yes; 3D Model: fc143cca1e79419f9cd78b61e9279f08; 3D Model Transform: 31.8897,63.7794,0,90,0,0,0,0,0; Tolerance: ±1%; Power(Watts): 100mW; Voltage-Supply(Max): 75V; Symbol: FRC0603F9102TS; Device: FRC0603F9102TS; Convert to PCB: yes; Supplier Footprint: 0603; Value: 91kΩ; LCSC Part Name: 91kΩ ±1% 100mW 厚膜电阻; Supplier Part: C2907077; Manufacturer Part: FRC0603F9102TS; JLCPCB Part Class: Extended Part; Supplier: LCSC; Type: 厚膜电阻; Temperature Coefficient: ±100ppm/℃; Operating Temperature: -55℃~+155℃; FootprintName: R0603; ModelName: R0603
TP_3V3 TP_3V3_PROT1 TP_BAT1 TP_CE_N1 TP_CHG_GATE1 TP_GND1 TP_M5_RESET1 TP_NTC_TS1 TP_SYS1 TP_VBUS_PROT1 = Test-Point: Test Point 测试点; AddInBom: yes; Symbol: Test-Point; Device: Test-Point; ConvertToPcb: yes; FootprintName: Test-Point-0.5mm
U1 = BQ25185DLHR: 工作电压:3V~18V;最大充电电流:1A;电池类型:锂电池；磷酸铁锂电池;电池节数:1;; Manufacturer: TI(德州仪器); AddInBom: yes; ModelId: 4a262488f9d14eb09b8c4554f47b1590聨0819f05c4eef4c71ace90d822a990e87; ModelTransform: 87.4014,79.1337,0,90,0,0,-0.002,0.003,0; The Chip Type: 充电芯片; Voltage - Supply: 3V~18V; Charge Current - Max: 1A; Charging Saturation Voltage: 4.4V; End-Off Voltage: 2.2V; Number of Cells: 1; Battery Temperature Detection: 支持; Supply Current (Iq): 4uA; Symbol: BQ25185DLHR; Device: BQ25185DLHR; LCSC Part Name: 单节1A独立线性电池充电器，具备电源路径、工厂模式和电池跟踪功能; SupplierPart: C19725033; ManufacturerPart: BQ25185DLHR; Supplier Footprint: WSON-10-EP(2.2x2); JLCPCB Part Class: Extended Part; Datasheet: https://www.ti.com.cn/cn/lit/ds/symlink/bq25185.pdf?ts=1739415017761&ref_url=https%253A%252F%252Fwww.ti.com.cn%252Fproduct%252Fcn%252FBQ25185%253FkeyMatch%253Dbq25185%2526tisearch%253Duniversal_search; Supplier: LCSC; ConvertToPcb: yes; FootprintName: WSON-10_L2.2-W2.0-P0.40-BL-EP_TI_DLH0010A; ModelName: WSON-10_L2.2-W2.0-P0.40-BL-EP_TI_DLH0010A; Type of Battery: 锂电池；磷酸铁锂电池; Operating Temperature: -40℃~+125℃; 0V Battery Charge: -; Balance Current: -; Interface: -; Features: -
U2 = TPS259474LRPWR: 工作电压:2.7V~23V;; Manufacturer: TI(德州仪器); AddInBom: yes; ModelId: c74b11dc6301497d8044a28629695f2c聨0819f05c4eef4c71ace90d822a990e87; ModelTransform: 79.1337,78.74,0,0,0,0,0,0,0; Symbol: TPS259474LRPWR; Device: TPS259474LRPWR; LCSC Part Name: TPS259474LRPWR; SupplierPart: C2864845; ManufacturerPart: TPS259474LRPWR; Supplier Footprint: VQFN-10-HR(2x2); JLCPCB Part Class: Extended Part; Datasheet: https://www.ti.com/cn/lit/gpn/tps25947; Supplier: LCSC; ConvertToPcb: yes; FootprintName: VQFN-10_L2.0-W2.0-P0.45-TL; ModelName: VQFN-10_L2.0-W2.0-P0.45-TL; Voltage Rating: 2.7V~23V; Operating temperature: -40℃~+125℃
U3 = TLV7041DBVR: 比较器数:单路;输入失调电压(Vos):100uV;输入偏置电流(Ib):2pA;轨到轨:轨到轨输入;; Manufacturer: TI(德州仪器); 3D Model: 7ba65df16e7b4570af156e925f9c37fe聨0819f05c4eef4c71ace90d822a990e87; 3D Model Transform: 114.173,114.173,0,90,0,0,0,0,0; Number of Channels: 单路; Vos - Input Offset Voltage: 100uV; Ib - Input Bias Current: 2pA; Propagation Delay Time: 3us; Input Hysteresis Voltage (Vhys): 7mV; Common Mode Rejection Ratio(CMRR): 73dB; Output Type: 开漏; Rail to Rail: 轨到轨输入; Quiescent Current: 315nA; Maximum Power Supply Range (Vdd-Vss): 7V; Single Supply: 1.6V~6.5V; Input Offset Current(Ios): 1pA; Response Time (tr): 4.5ns; AddInBom: yes; Symbol: TLV7041DBVR; Device: TLV7041DBVR; LCSC Part Name: 小尺寸、毫微功耗、低电压比较器; Supplier Part: C702122; Manufacturer Part: TLV7041DBVR; Supplier Footprint: SOT-23-5; JLCPCB Part Class: Extended Part; Datasheet: https://www.ti.com/cn/lit/ds/symlink/tlv7042.pdf; Supplier: LCSC; Output Mode: -; Operating Temperature: -40℃~+125℃; Features: -; ConvertToPcb: yes; FootprintName: SOT-23-5_L2.9-W1.6-P0.95-LS2.8-BR; ModelName: SOT-23-5_L2.9-W1.6-P0.95-LS2.8-BR
U4 = SN74LVC2G132DCUR: 逻辑类型:与非门;通道数:2;工作电压:1.65V~5.5V;静态电流(Iq):10uA;传播延迟(tpd):5ns@5V,50pF;; Manufacturer: TI(德州仪器); AddInBom: yes; ModelId: 263382641c5b4ff3a87f82a73a2b65fc聨0819f05c4eef4c71ace90d822a990e87; ModelName: US-8_L2.0-W2.3-H0.9-LS3.1-P0.50; ModelTransform: 130.141,78.74,0,0,0,0,0,0,0; Logic Type: 与非门; Number of Channels: 2; Quiescent Current: 10uA; Current - Output Low(IOL): 32mA; Input Logic Level - High: 1.16V~3.33V; Input Logic Level - Low: 390mV~1.87V; Output Logic Level - High: 1.9V；2.4V；2.3V；1.2V；3.8V; Output Logic Level - Low: 300mV；400mV；450mV；550mV~650mV; Symbol: SN74LVC2G132DCUR; Device: SN74LVC2G132DCUR; LCSC Part Name: 带施密特触发器输入的双2输入与非门; SupplierPart: C130201; ManufacturerPart: SN74LVC2G132DCUR; Supplier Footprint: VSSOP-8; JLCPCB Part Class: Extended Part; Datasheet: https://www.ti.com/cn/lit/ds/symlink/sn74lvc2g132.pdf; Supplier: LCSC; ConvertToPcb: yes; FootprintName: US-8_L2.4-W2.1-P0.50-LS3.2-BR; Voltage - Supply: 1.65V~5.5V; Current - Output High(IOH): 32mA; Series: 74LVC系列; Propagation Delay: 5ns@5V,50pF; Operating Temperature: -40℃~+125℃; Input Number: 2; Features: 局部关断模式；带电插入保护；后驱动保护
U5 = TPS63802DLAR_C2845237: 功能类型:升降压型;工作电压:1.3V~5.5V;输出电压:1.8V~5.2V;输出电流:2A;输出类型:可调;; Manufacturer: TI(德州仪器); AddInBom: yes; ModelId: 8792291f24e34a10af08ce4e3a8467a6聨0819f05c4eef4c71ace90d822a990e87; ModelTransform: 78.74,118.11,0,0,0,0,0,0,0; Function: 升降压型; Output Current: 2A; Frequency - Switching: 2.1MHz；1.4MHz；1.6MHz; Synchronous Rectifier: 是; Number of Outputs: 1; Topology: 降压-升压式; Quiescent Current: 11uA; Switch tube (built-in/external): 内置; Output Type: 可调; Symbol: TPS63802DLAR; Device: TPS63802DLAR_C2845237; LCSC Part Name: 升降压型 2A 1.3V~5.5V; SupplierPart: C2845237; ManufacturerPart: TPS63802DLAR; Supplier Footprint: VSON-10(2x3); JLCPCB Part Class: Extended Part; Datasheet: https://www.ti.com/cn/lit/gpn/tps63802; Supplier: LCSC; ConvertToPcb: yes; FootprintName: VSON-10_L3.0-W2.0-P0.50-TL; ModelName: VSON-10_L3.0-W2.0-P0.50-TL; Voltage - Supply: 1.3V~5.5V; Output Voltage: 1.8V~5.2V; Operating Temperature: -40℃~+125℃@(TJ); Features: 轻载高效模式；过流保护；工作状态指示；负载断开
U6 = TUSB320LAIRWBR: 工作电压:2.7V~5V;最大充电电流:3A;电池类型:-;电池节数:-;; Manufacturer: TI(德州仪器); AddInBom: yes; ModelId: 44059ae8db6646beab575f8044eac94d聨0819f05c4eef4c71ace90d822a990e87; ModelName: X2QFN-12_L1.6-W1.6-H0.4-P0.40-TL; ModelTransform: 62.992,62.992,0,0,0,0,0,0,0; Charge Current - Max: 3A; Battery Temperature Detection: 不支持; Supply Current (Iq): 70uA; Interface: I2C; Symbol: TUSB320LAIRWBR; Device: TUSB320LAIRWBR; LCSC Part Name: USB Type-C 配置通道逻辑和端口控制器; SupplierPart: C132554; ManufacturerPart: TUSB320LAIRWBR; Supplier Footprint: X2-QFN-12(1.6x1.6); JLCPCB Part Class: Extended Part; Datasheet: https://www.ti.com/cn/lit/gpn/tusb320lai; Supplier: LCSC; ConvertToPcb: yes; FootprintName: X2QFN-12_L1.6-W1.6-P0.40-TL; The Chip Type: -; Voltage - Supply: 2.7V~5V; Charging Saturation Voltage: -; End-Off Voltage: -; Type of Battery: -; Number of Cells: -; Operating Temperature: -40℃~+85℃; 0V Battery Charge: 不支持; Balance Current: -; Features: 可编程充电电流
USBC1 = TYPE-C-31-M-12: 连接器类型:Type-C;协议标准:-;公母:母;安装方式:卧贴;触点数量:16P;端口数量:1;额定电流 - 电源:5A;工作温度:-30℃~+80℃;; Manufacturer: 韩国韩荣; AddInBom: yes; ModelId: 2a22bb5af8894b85972aeeacf9cd92d0聨0819f05c4eef4c71ace90d822a990e87; ModelTransform: 351.9678,311.023,0,180,0,0,0,-43.307,-33.465; Connector Type: Type-C; Gender: 母; Number of Contacts: 16P; Number of Ports: 1; Current Rating-Power: 5A; Voltage Rating: 20V; Connect-Disconnect Life: 1万次; Symbol: TYPE-C-31-M-12; Device: TYPE-C-31-M-12; LCSC Part Name: Type-C 母 卧贴; SupplierPart: C165948; ManufacturerPart: TYPE-C-31-M-12; Supplier Footprint: SMD; JLCPCB Part Class: Extended Part; Datasheet: https://item.szlcsc.com/datasheet/TYPE-C-31-M-12/177331.html; Supplier: LCSC; ConvertToPcb: yes; FootprintName: USB-C_SMD-TYPE-C-31-M-12_1; ModelName: USB-C_SMD-TYPE-C-31-M-12_1; Protocol Standard: -; Mounting Type: 卧贴; Length: 7.35mm; Operating Temperature: -30℃~+80℃